# Altium schematic sheet RTC_Section.SchDoc
size A4; SheetNumber: 8; SheetTotal: 8
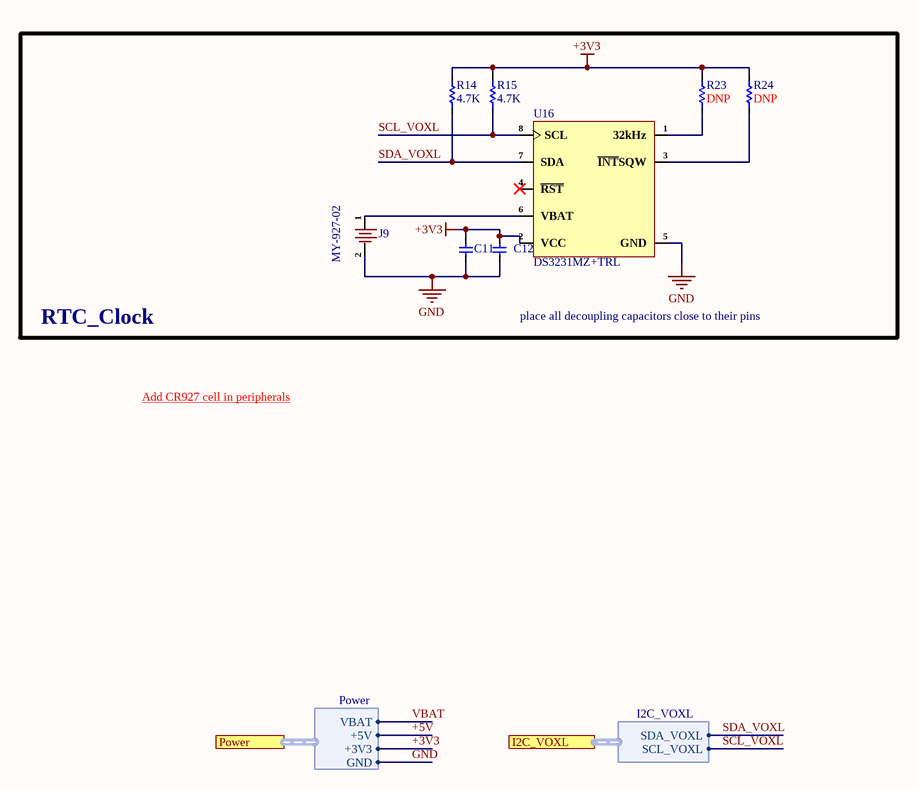
[diagram p0: RTC_Section.SchDoc]

## Parts
C11  1uF  [Cap-0402]  (value not drawn)
C12  100nF  [cap-0402]  (value not drawn)
J9  MY-927-02  [MY-927-02]
R14  4.7K  [Res-0402]
R15  4.7K  [Res-0402]
R23  DNP  [Res-0402]
R24  DNP  [Res-0402]
U16  DS3231MZ+TRL  [SOIC-8(0.154", 3.90mm Width)]

## Ports
I2C_VOXL (harness I2C_VOXL, see Top-Sheet[3C], Connector_Section[2D], Controller_Section[2D]), Power (harness Power, see Top-Sheet[3C], Connector_Section[4D], Controller_Section[2D], FlashMemory_Section[1D], Power_Section[3D], USB HUB_Section[1D], WiFiModule_Section[2D])

## Harnesses
Power: +5V, +3V3, GND, VBAT
I2C_VOXL: SCL_VOXL, SDA_VOXL

## Nets
+3V3: C11.2 C12.2 R14.2 R15.2 R23.2 R24.2 U16.2(VCC) ; port Power.+3V3
GND: C11.1 C12.1 J9.2(-) U16.5(GND) ; port Power.GND
+5V: port Power.+5V
SCL_VOXL: R15.1 U16.8(SCL) ; port I2C_VOXL.SCL_VOXL
SDA_VOXL: R14.1 U16.7(SDA) ; port I2C_VOXL.SDA_VOXL
VBAT: port Power.VBAT
NetJ9_1: J9.1(+) U16.6(VBAT)
NetR23_1: R23.1 U16.1(32kHz)
NetR24_1: R24.1 U16.3(~{INT}SQW)

Not connected (* = marked no-connect by the designer): U16 4(~{RST})*

## Notes on the sheet
- RTC_Clock
- place all decoupling capacitors close to their pins
- Add CR927 cell in peripherals <https://www.digikey.com/en/products/detail/micropower-battery-company/CR927/14565058>
- File:
- Title:
- Date:
- Page
- Num:
- Total:
- Drawn By: Huzaifa Ali

## Library data of the parts
C11 = CC0402KRX5R8BB105: CAP CER 1UF 25V X5R 0402; Manufacturer: Yageo; Tolerance: 10%; Supplier 1: Mouser; Manufacturer Part Number: CC0402KRX5R8BB105; RoHS: Yes; Category: Ceramic Capacitors; Stock 1: 91975; Pricing 1: 1=0.30000, 10=0.20400, 50=0.20400, 100=0.11600, 1000=0.07200, 10000=0.05900 (USD); Mount: Surface Mount; Case/Package: 0402; Case Code (Metric): 1005; Case Code (Imperial): 0402; Weight: 2.3E-05oz; Min Operating Temperature: -55°C; Max Operating Temperature: 85°C; Packaging: Tape and Reel; Capacitance: 1uF; Voltage Rating: 25V; Dielectric: X5R; Termination: SMD/SMT; Voltage Rating (DC): 25V; Package Quantity: 10000; Length: 0.039inch; Width: 0.02inch; Thickness: 0.022inch; Lead Free: Lead Free; Halogen Free: Halogen Free; RoHS Compliant: Yes; ComponentLink1URL: http://www.mouser.com/ds/2/447/Yageo_UPY-GP_NP0_16V-to-50V_9-358835.pdf?src-supplier=Mouser; ComponentLink1Description: http://www.mouser.com/ds/2/447/Yageo_UPY-GP_NP0_16V-to-50V_9-358835.pdf?src-supplier=Mouser; ComponentLink2URL: http://www.yageo.com/documents/recent/UPY-GPHC_X5R_4V-to-50V_25.pdf?src-supplier=Digi-Key; ComponentLink2Description: http://www.yageo.com/documents/recent/UPY-GPHC_X5R_4V-to-50V_25.pdf?src-supplier=Digi-Key; ComponentLink3URL: https://4donline.ihs.com/images/VipMasterIC/IC/YAGO/YAGO-S-A0006851646/YAGO-S-A0006851646-1.pdf?hkey=6D3A4C79FDBF58556ACFDE234799DDF0&src-supplier=Newark; ComponentLink3Description: https://4donline.ihs.com/images/VipMasterIC/IC/YAGO/YAGO-S-A0006851646/YAGO-S-A0006851646-1.pdf?hkey=6D3A4C79FDBF58556ACFDE234799DDF0&src-supplier=Newark; Supplier Part Number 1: 603-CC402KRX5R8BB105; LCSC Part Number: C326568
C12 = C1005X7R1H104KT000F: CAP CER 0.1UF 50V X7R 0402; Manufacturer: TDK; Tolerance: 10%; Voltage: 25V; Item Type: Capacitor; Supplier 1: Avnet; Manufacturer Part Number: C1005X7R1H104KT000F; RoHS: No; Category: Ceramic Capacitors; Dielectric: X7R; Supplier Part Number 1: C1005X7R1H104KT000F; LCSC Part Number: C361198; ComponentLink1Description: LCSC; ComponentLink1URL: https://www.lcsc.com/product-detail/Multilayer-Ceramic-Capacitors-MLCC-SMD-SMT_TDK-C1005X7R1H104KT000F_C361198.html
J9 = MY-927-02: Battery clip Nickel Phosphor Bronze CR927 SMD Button And Strip Battery Connector ROHS; Manufacturer: MYOUNG; Manufacturer Part Number: MY-927-02; Package: SMD; LCSC Part Number: C2902336; Item Type: Battery Connector; ComponentLink1Description: LCSC; ComponentLink1URL: https://www.lcsc.com/product-detail/Button-And-Strip-Battery-Connector_MYOUNG-MY-927-02_C2902336.html
R14 R15 R23 R24 = RC0402FR-074K7L: RES 4.7K OHM 1% 1/16W 0402; Manufacturer: Yageo; Voltage Rating (DC): 50V; Power Rating: 62.5mW; Resistance: 4.7kR; Temperature Coefficient: 100ppm/°C; Max Power Dissipation: 63mW; Item Type: Resistor; Supplier 1: Avnet; Manufacturer Part Number: RC0402FR-074K7L; RoHS: Yes; Category: Chip SMD Resistors; Stock 1: 2420000; Pricing 1: 10000=0.00085 (USD); Case/Package: 0402; Number of Pins: 2; Case Code (Imperial): 0402; Case Code (Metric): 1005; Size Code: 0402; Min Operating Temperature: -55°C; Max Operating Temperature: 155°C; Tolerance: 1%; Voltage Rating: 50V; Packaging: Tape and Reel; Resistor Type: Thick Film; Termination: SMD/SMT; Features: Moisture Resistant; Series: RC; Number of Terminations: 2; Resistance Tolerance: 1%; Construction: Rectangular; Length: 1mm; Width: 0.5mm; Height: 0.32mm; Depth: 0.5mm; Height - Seated (Max): 0.016inch; RoHS Compliant: Yes; Reach SVHC Compliant: Yes; Military Standard: Not; Lead Free: Lead Free; ComponentLink1URL: https://datasheet.ciiva.com/22661/1686128-22661342.pdf?src-supplier=Element14; ComponentLink1Description: https://datasheet.ciiva.com/22661/1686128-22661342.pdf?src-supplier=Element14; ComponentLink2URL: https://datasheet.ciiva.com/7850/1018594-7850022.pdf?src-supplier=Element14; ComponentLink2Description: https://datasheet.ciiva.com/7850/1018594-7850022.pdf?src-supplier=Element14; ComponentLink3URL: https://datasheet.ciiva.com/7850/1018594-7850023.pdf?src-supplier=Element14; ComponentLink3Description: https://datasheet.ciiva.com/7850/1018594-7850023.pdf?src-supplier=Element14; ComponentLink4URL: https://datasheet.ciiva.com/15215/getdatasheetpartid-328119-15215035.pdf?src-supplier=Verical; ComponentLink4Description: https://datasheet.ciiva.com/15215/getdatasheetpartid-328119-15215035.pdf?src-supplier=Verical; Supplier Part Number 1: RC0402FR-074K7L; LCSC Part Number: C105871
U16 = DS3231MZ+TRL: IC RTC CLK/CALENDAR I2C 8SOIC; Manufacturer: Maxim; Interface: I2C,Serial,2-Wire; Logic Function: Clock; Min Supply Voltage: 2.3V; Max Supply Voltage: 5.5V; Time Format: HH:MM:SS (12/24 hr); Date Format: YY-MM-DD-dd; Operating Supply Voltage: 3.3V; Supplier: Mouser; LCSC Part Number: C107410; Manufacturer Part Number: DS3231MZ+TRL; RoHS: Yes; Item Type: IC; Stock: 7947; Pricing: 1=12.6, 10=8.92, 50=7.97, 100=6.91, 1000=5.9, 10000=5.9 (USD); Mounting Technology: Surface Mount; Case/Package: SOIC; Pins: 8; Min Operating Temperature: -40°C; Max Operating Temperature: 85°C; Packaging: Tape and Reel; Package Quantity: 1000; Series: DS3231MZ; Radiation Hardening: No; Reach SVHC Compliant: Unknown; RoHS Compliant: Yes; ComponentLink1URL: https://datasheet.ciiva.com/1243/ds3231m-1243728.pdf?src-supplier=Digikey; ComponentLink1Description: https://datasheet.ciiva.com/1243/ds3231m-1243728.pdf?src-supplier=Digikey; ComponentLink2URL: https://datasheet.ciiva.com/14244/ds3231m-14244349.pdf?src-supplier=Avnet; ComponentLink2Description: https://datasheet.ciiva.com/14244/ds3231m-14244349.pdf?src-supplier=Avnet; ComponentLink3URL: https://datasheet.ciiva.com/12291/ds3231m-35560-12291992.pdf?src-supplier=Mouser; ComponentLink3Description: https://datasheet.ciiva.com/12291/ds3231m-35560-12291992.pdf?src-supplier=Mouser